# Altium schematic sheet 3G_Section.SchDoc
size A4; DocumentNumber: 10; SheetNumber: 10; SheetTotal: 28
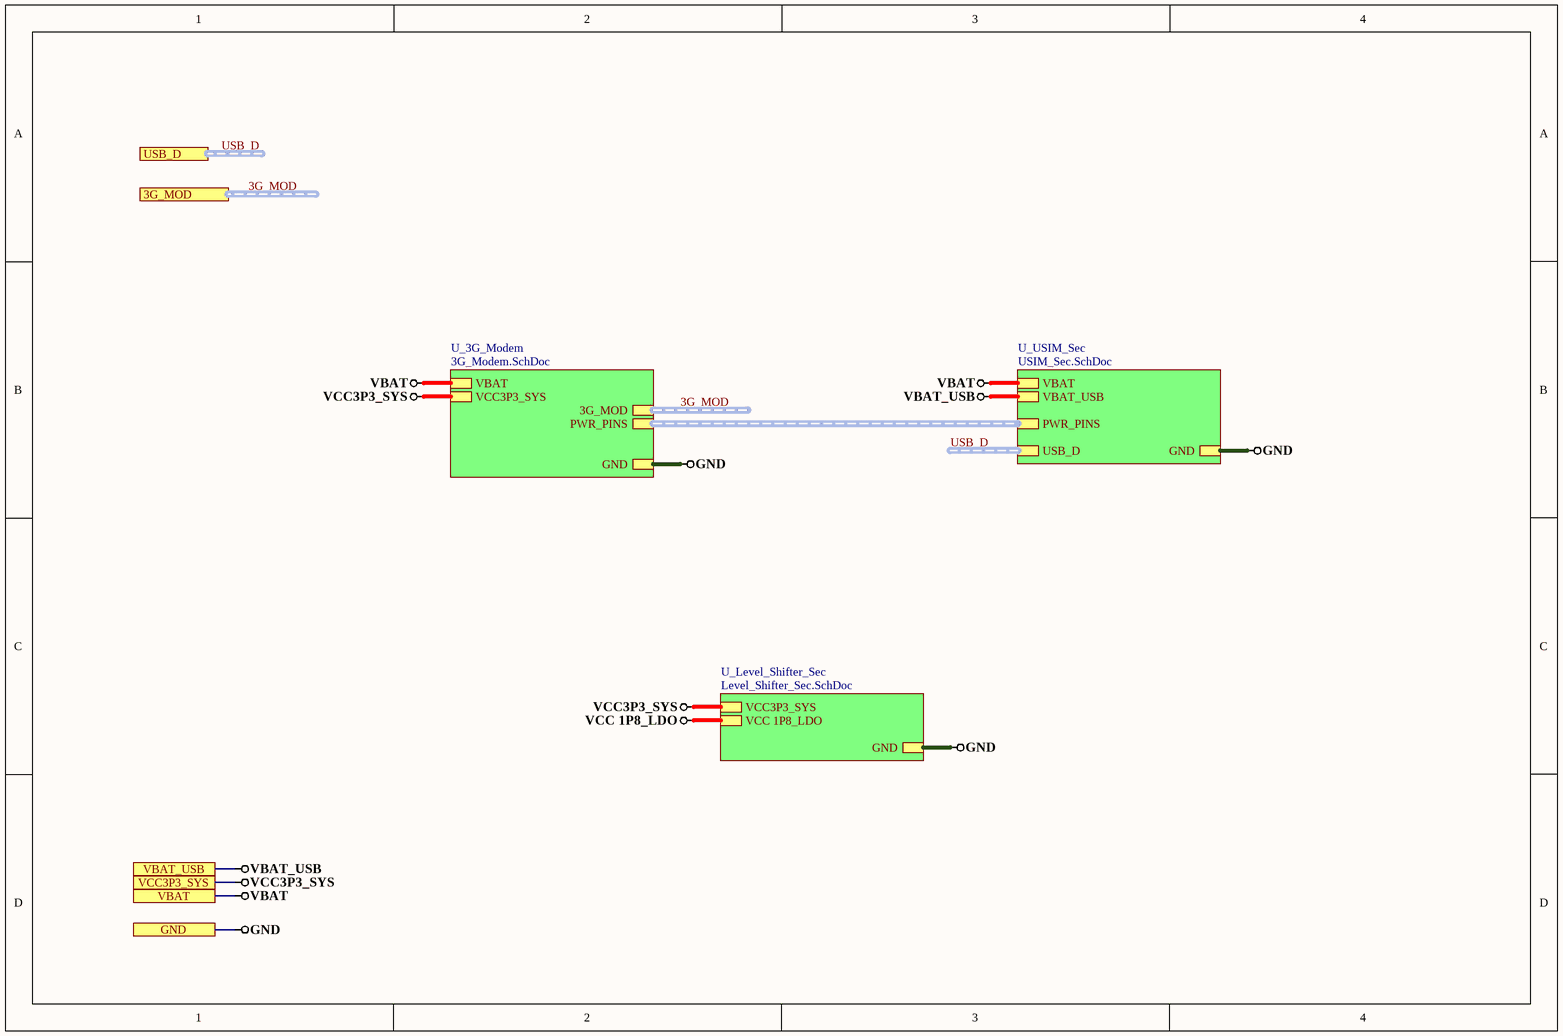
[diagram p0: 3G_Section.SchDoc]

## Sub-sheets
U_3G_Modem = 3G_Modem.SchDoc: GND, VBAT, VCC3P3_SYS, 3G_MOD (harness 3G_MOD), PWR_PINS (harness PWR_PINS)
U_Level_Shifter_Sec = Level_Shifter_Sec.SchDoc: GND, VCC3P3_SYS, VCC 1P8_LDO
U_USIM_Sec = USIM_Sec.SchDoc: USB_D (harness USB_D), VBAT, GND, VBAT_USB, PWR_PINS (harness PWR_PINS)

## Ports
3G_MOD (harness 3G_MOD), GND, USB_D (harness USB_D), VBAT, VBAT_USB, VCC3P3_SYS

## Nets
GND: port GND, sheet U_USIM_Sec/GND, sheet U_3G_Modem/GND, sheet U_Level_Shifter_Sec/GND
VBAT: port VBAT, sheet U_USIM_Sec/VBAT, sheet U_3G_Modem/VBAT
VBAT_USB: port VBAT_USB, sheet U_USIM_Sec/VBAT_USB
VCC3P3_SYS: port VCC3P3_SYS, sheet U_3G_Modem/VCC3P3_SYS, sheet U_Level_Shifter_Sec/VCC3P3_SYS
VCC 1P8_LDO: sheet U_Level_Shifter_Sec/VCC 1P8_LDO

## Buses and harness runs
harness 3G_MOD = port 3G_MOD
harness 3G_MOD = sheet U_3G_Modem/3G_MOD
harness sheet U_3G_Modem/PWR_PINS = sheet U_USIM_Sec/PWR_PINS
harness USB_D = port USB_D
harness USB_D = sheet U_USIM_Sec/USB_D